# Altium schematic sheet 2025_İDA_Blok_Diyagram.SchDoc
size A4; SheetNumber: 1; SheetTotal: 6
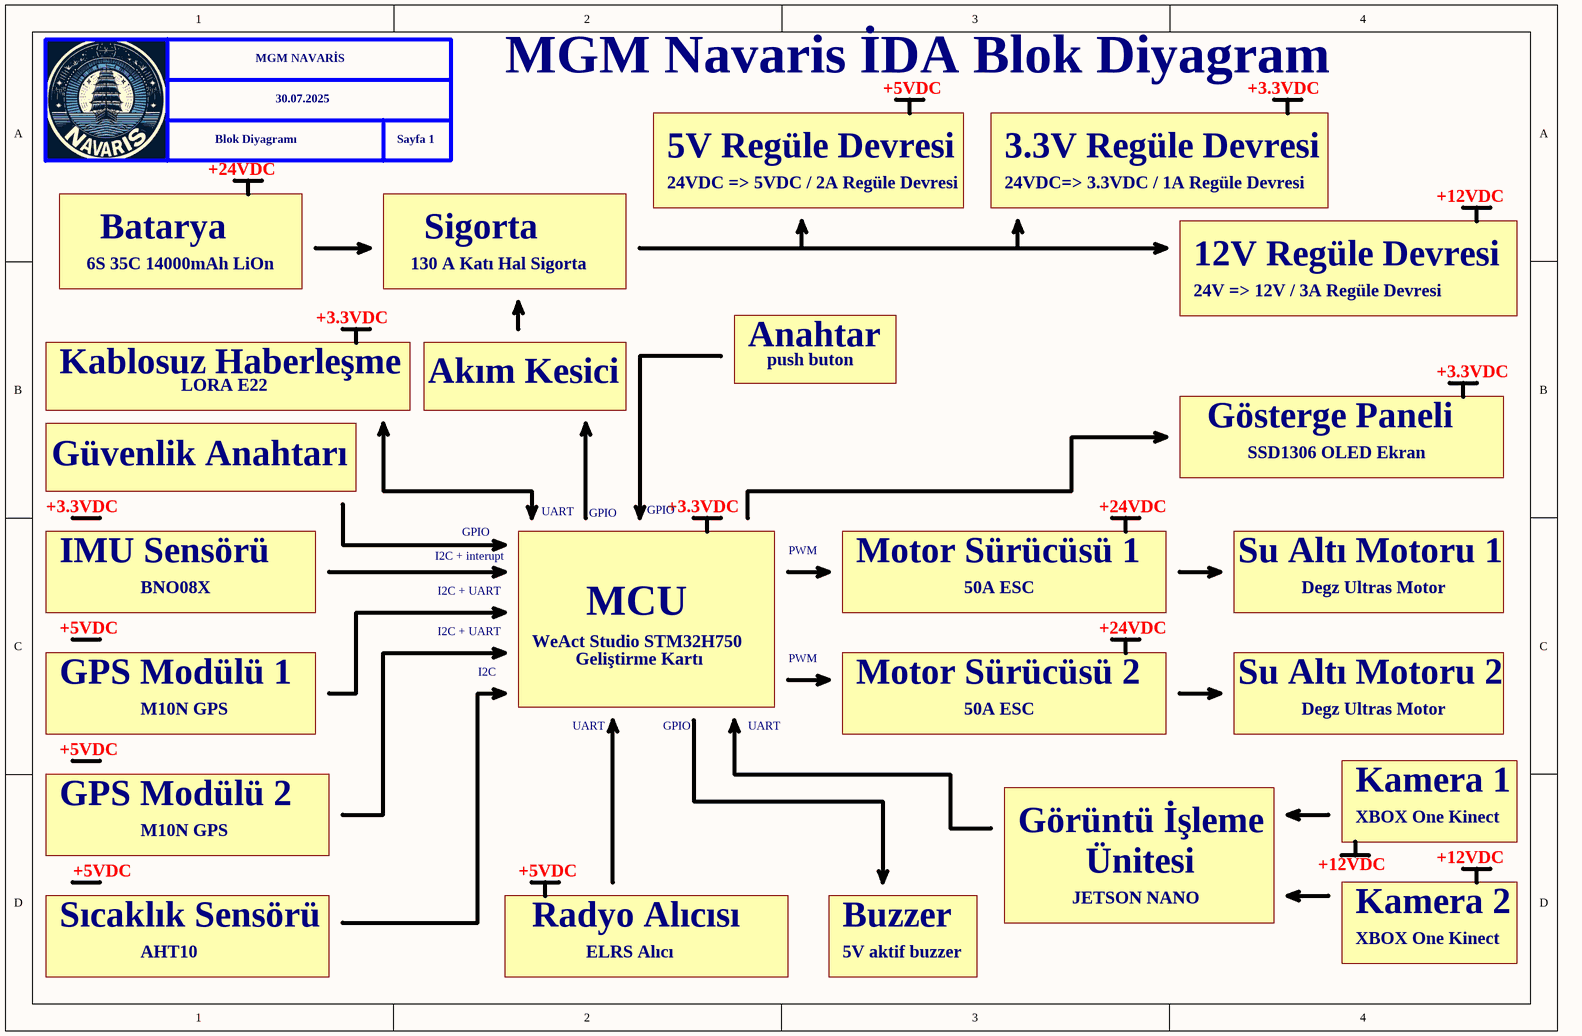
[diagram p0: 2025_İDA_Blok_Diyagram.SchDoc]

## Notes on the sheet
- MGM NAVARİS
- 30.07.2025
- MGM Navaris İDA Blok Diyagram
- +5VDC
- +3.3VDC
- +24VDC
- Blok Diyagramı
- Sayfa 1
- 5V Regüle Devresi
- 3.3V Regüle Devresi
- Batarya
- Sigorta
- 24VDC => 5VDC / 2A Regüle Devresi
- 24VDC=> 3.3VDC / 1A Regüle Devresi
- +12VDC
- 6S 35C 14000mAh LiOn
- 130 A Katı Hal Sigorta
- 12V Regüle Devresi
- 24V => 12V / 3A Regüle Devresi
- Kablosuz Haberleşme
- Anahtar
- push buton
- LORA E22
- Akım Kesici
- Gösterge Paneli
- Güvenlik Anahtarı
- UART
- GPIO
- SSD1306 OLED Ekran
- IMU Sensörü
- I2C + interupt
- PWM
- Motor Sürücüsü 1
- Su Altı Motoru 1
- BNO08X
- I2C + UART
- WeAct Studio STM32H750
- MCU
- 50A ESC
- Degz Ultras Motor
- GPS Modülü 1
- M10N GPS
- I2C
- Geliştirme Kartı
- Motor Sürücüsü 2
- Su Altı Motoru 2
- GPS Modülü 2
- Görüntü İşleme
- Kamera 1
- XBOX One Kinect
- JETSON NANO
- Ünitesi
- Kamera 2
- Sıcaklık Sensörü
- AHT10
- Radyo Alıcısı
- ELRS Alıcı
- Buzzer
- 5V aktif buzzer